# Altium schematic sheet Atrium_Radio_Island.SchDoc
size 420 x 297 mm; Symbol: Drawing-Symbol_A3; @Project Name: Atrium; @Page Count: 1; @Update Date: 2026-11-10; @Create Date: 2026-11-10; @Schematic Name: Radio_Schematic; @Page No: 1; @Page Name: P1; Company: EasyEDA.com; Version: V1.0; Page Size: A3; Device: Drawing-Symbol_A3; @Create Time: 01:51:16; @Update Time: 18:07:46; Border: 1; Width: 1655; Height: 1170; Region Start: 1; X Region Count: 6; Y Region Count: 4; Blade Width: 10; Title Block Position: 3; @Board Name: Radio_Island
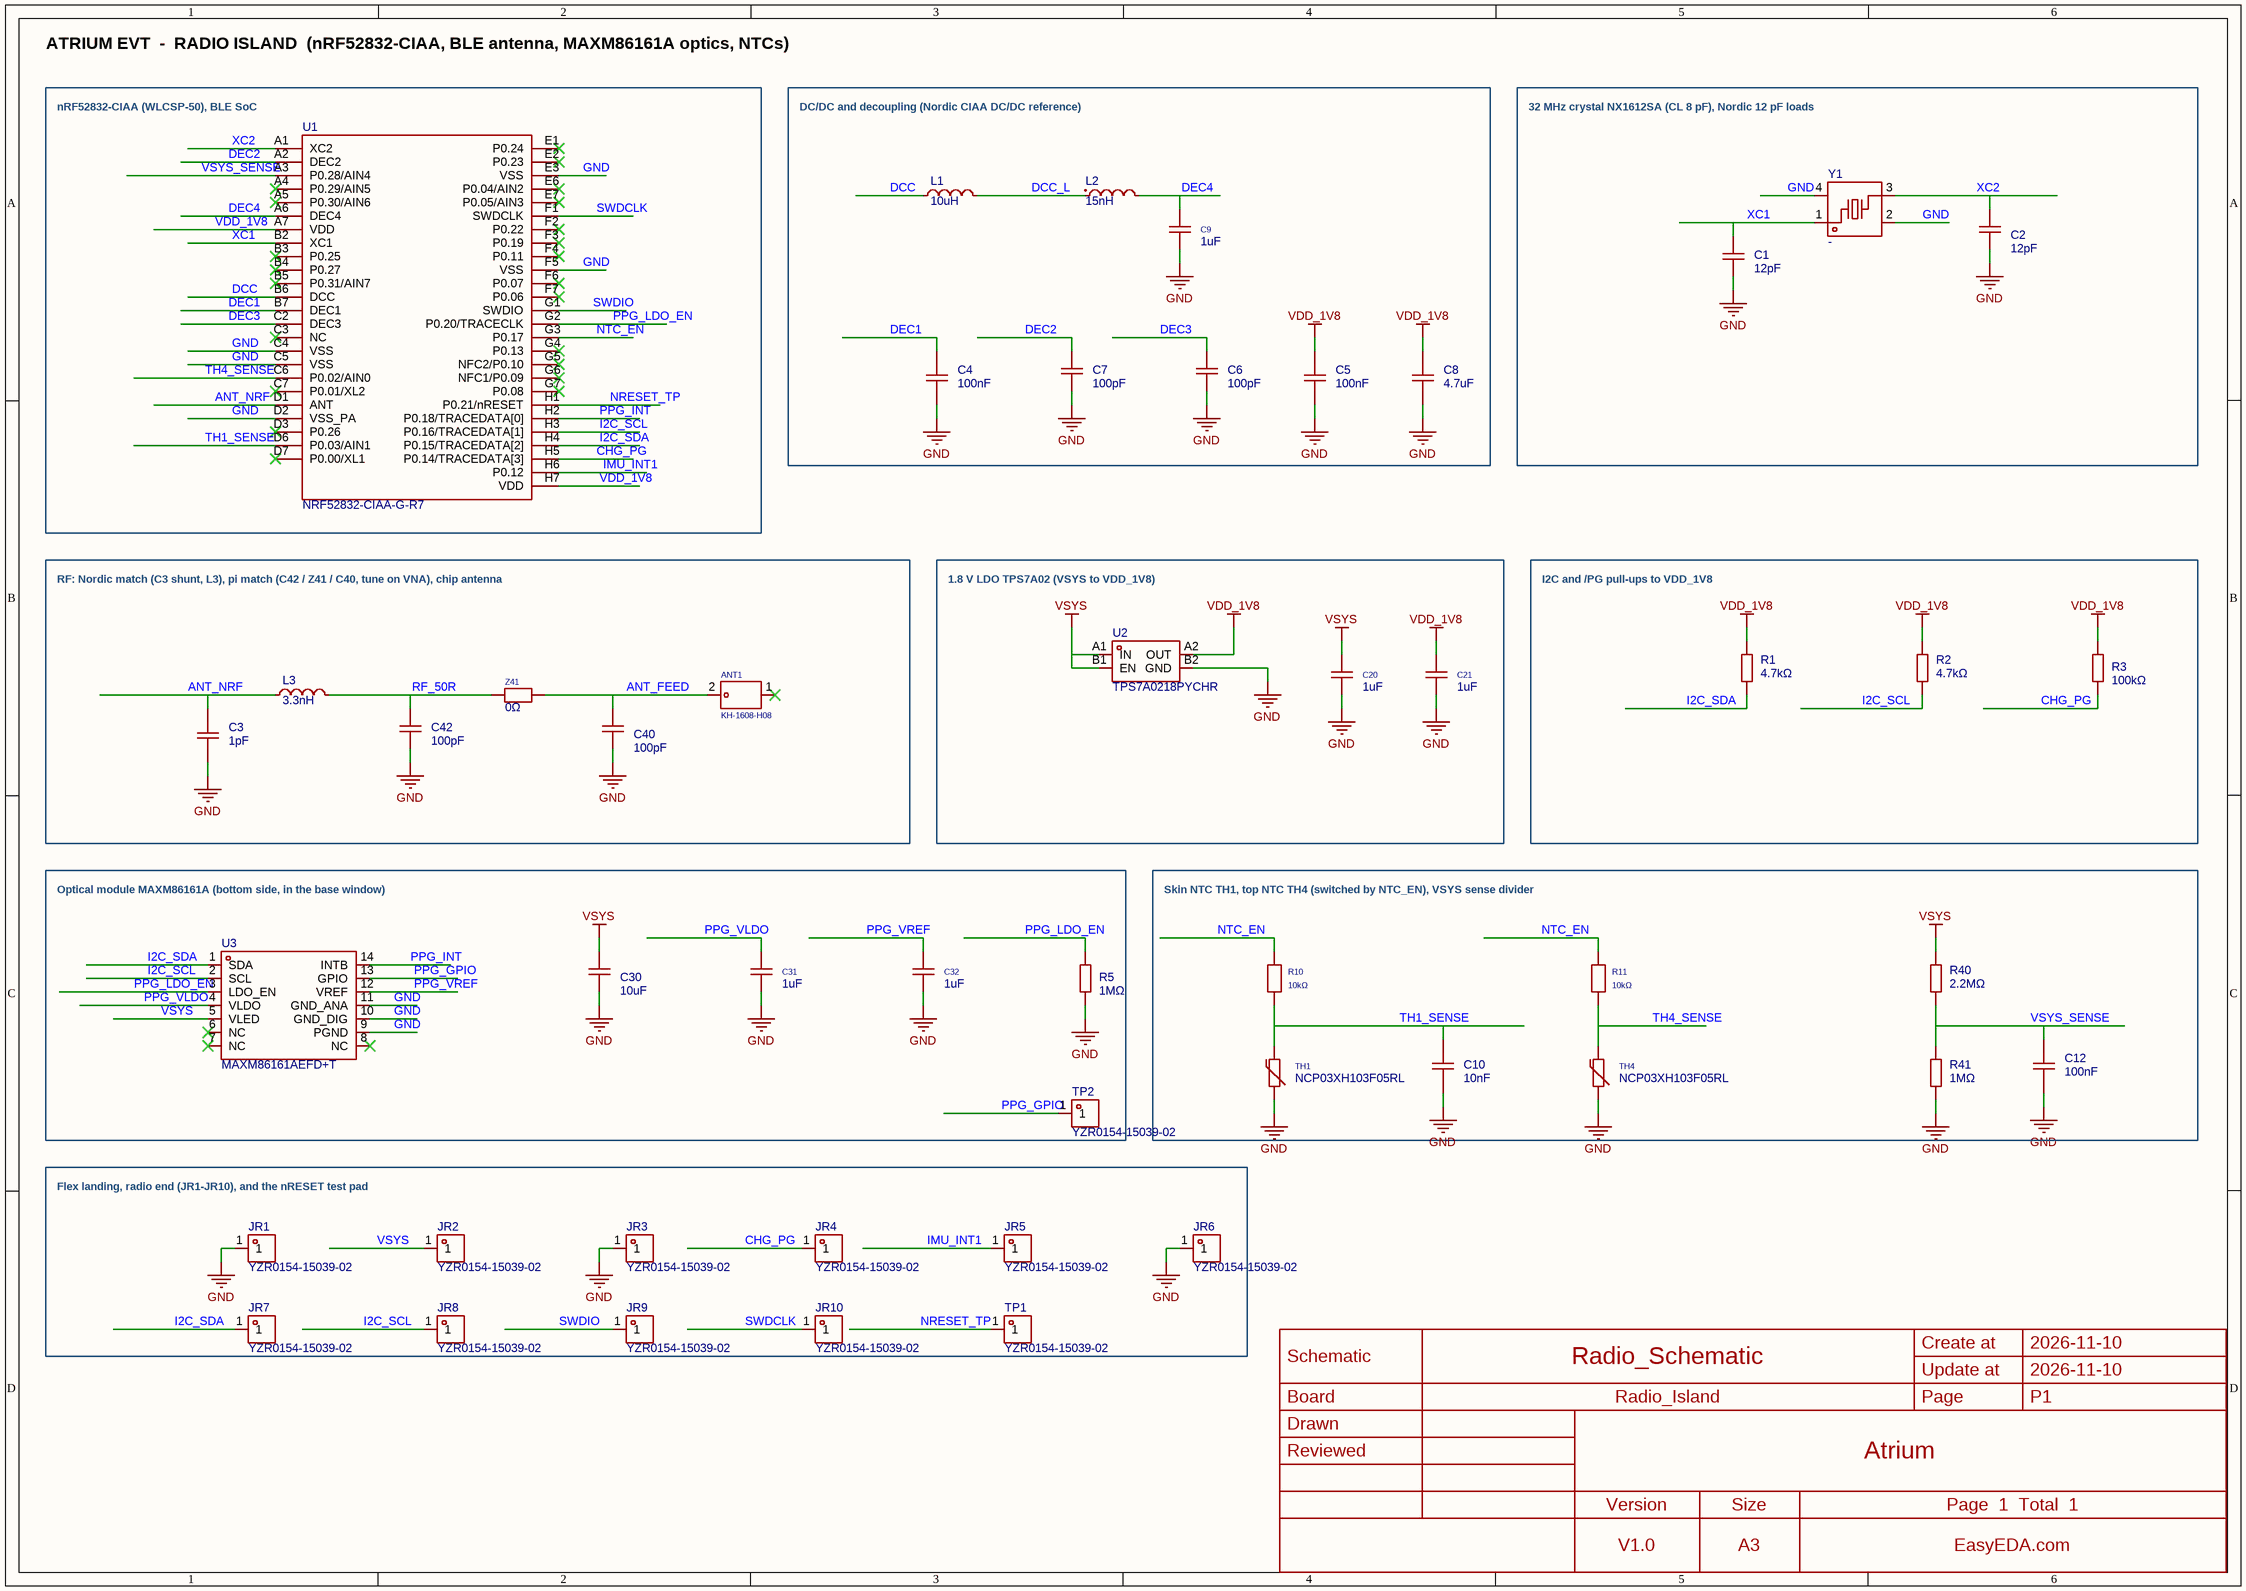
[diagram p0: Atrium_Radio_Island.SchDoc]

## Parts
ANT1  KH-1608-H08  [ANT-SMD_L1.7-W0.9]
C1  12pF  [C0201]
C2  12pF  [C0201]
C3  1pF  [C0201]
C4  100nF  [C0201]
C5  100nF  [C0201]
C6  100pF  [C0201]
C7  100pF  [C0201]
C8  4.7uF  [C0201]
C9  1uF  [C0201]
C10  10nF  [C0201]
C12  100nF  [C0201]
C20  1uF  [C0201]
C21  1uF  [C0201]
C30  10uF  [C0402]
C31  1uF  [C0201]
C32  1uF  [C0201]
C40  100pF  [C0201]
C42  100pF  [C0201]
JR1  YZR0154-15039-02  [TESTPOINT-SMD_BD1.5-H3.9]
JR2  YZR0154-15039-02  [TESTPOINT-SMD_BD1.5-H3.9]
JR3  YZR0154-15039-02  [TESTPOINT-SMD_BD1.5-H3.9]
JR4  YZR0154-15039-02  [TESTPOINT-SMD_BD1.5-H3.9]
JR5  YZR0154-15039-02  [TESTPOINT-SMD_BD1.5-H3.9]
JR6  YZR0154-15039-02  [TESTPOINT-SMD_BD1.5-H3.9]
JR7  YZR0154-15039-02  [TESTPOINT-SMD_BD1.5-H3.9]
JR8  YZR0154-15039-02  [TESTPOINT-SMD_BD1.5-H3.9]
JR9  YZR0154-15039-02  [TESTPOINT-SMD_BD1.5-H3.9]
JR10  YZR0154-15039-02  [TESTPOINT-SMD_BD1.5-H3.9]
L1  10uH  [L0603]
L2  15nH  [L0402-R-RD]
L3  3.3nH  [L0201-RD]
R1  4.7kΩ  [R0201]
R2  4.7kΩ  [R0201]
R3  100kΩ  [R0201]
R5  1MΩ  [R0201]
R10  10kΩ  [R0201]
R11  10kΩ  [R0201]
R40  2.2MΩ  [R0201]
R41  1MΩ  [R0201]
TH1  NCP03XH103F05RL  [R0201]
TH4  NCP03XH103F05RL  [R0201]
TP1  YZR0154-15039-02  [TESTPOINT-SMD_BD1.5-H3.9]
TP2  YZR0154-15039-02  [TESTPOINT-SMD_BD1.5-H3.9]
U1  NRF52832-CIAA-G-R7  [WLCSP-50_L3.2-W3.0-TL_NRF52832]
U2  TPS7A0218PYCHR  [WLCSP-4_L0.6-W0.6-P0.35-R2-C2-TL]
U3  MAXM86161AEFD+T  [OLGA-14_L4.3-W2.9-P0.60-TL]
Y1  -  [CRYSTAL-SMD_4P-L1.6-W1.2-BL]
Z41  0Ω  [R0201]

## Blocks framed on the sheet
nRF52832-CIAA (WLCSP-50), BLE SoC: U1
DC/DC and decoupling (Nordic CIAA DC/DC reference): C4-C9 L1 L2
32 MHz crystal NX1612SA (CL 8 pF), Nordic 12 pF loads: C1 C2 Y1
1.8 V LDO TPS7A02 (VSYS to VDD_1V8): C20 C21 U2
I2C and /PG pull-ups to VDD_1V8: R1-R3
Optical module MAXM86161A (bottom side, in the base window): C30-C32 R5 TP2 U3
Flex landing, radio end (JR1-JR10), and the nRESET test pad: JR1-JR10 TP1

## Nets
GND: C1.2 C2.2 C3.2 C4.2 C5.2 C6.2 C7.2 C8.2 C9.2 C10.2 C12.2 C20.2 C21.2 C30.2 C31.2 C32.2 C40.2 C42.2 JR1.1 JR3.1 JR6.1 R5.2 R41.2 TH1.2 TH4.2 U1.C4(VSS) U1.C5(VSS) U1.D2(VSS_PA) U1.E3(VSS) U1.F5(VSS) U2.B2(GND) U3.9(PGND) U3.10(GND_DIG) U3.11(GND_ANA) Y1.2(GND) Y1.4(GND)
VDD_1V8: C5.1 C8.1 C21.1 R1.1 R2.1 R3.1 U1.A7(VDD) U1.H7(VDD) U2.A2(OUT)
VSYS: C20.1 C30.1 JR2.1 R40.1 U2.A1(IN) U2.B1(EN) U3.5(VLED)
ANT_FEED: ANT1.2(FEED) C40.1 Z41.2
ANT_NRF: C3.1 L3.1 U1.D1(ANT)
CHG_PG: JR4.1 R3.2 U1.H5(P0.14/TRACEDATA[3])
DCC: L1.1 U1.B6(DCC)
DCC_L: L1.2 L2.1
DEC1: C4.1 U1.B7(DEC1)
DEC2: C7.1 U1.A2(DEC2)
DEC3: C6.1 U1.C2(DEC3)
DEC4: C9.1 L2.2 U1.A6(DEC4)
I2C_SCL: JR8.1 R2.2 U1.H3(P0.16/TRACEDATA[1]) U3.2(SCL)
I2C_SDA: JR7.1 R1.2 U1.H4(P0.15/TRACEDATA[2]) U3.1(SDA)
IMU_INT1: JR5.1 U1.H6(P0.12)
NRESET_TP: TP1.1 U1.H1(P0.21/nRESET)
NTC_EN: R10.1 R11.1 U1.G3(P0.17)
PPG_GPIO: TP2.1 U3.13(GPIO)
PPG_INT: U1.H2(P0.18/TRACEDATA[0]) U3.14(INTB)
PPG_LDO_EN: R5.1 U1.G2(P0.20/TRACECLK) U3.3(LDO_EN)
PPG_VLDO: C31.1 U3.4(VLDO)
PPG_VREF: C32.1 U3.12(VREF)
RF_50R: C42.1 L3.2 Z41.1
SWDCLK: JR10.1 U1.F1(SWDCLK)
SWDIO: JR9.1 U1.G1(SWDIO)
TH1_SENSE: C10.1 R10.2 TH1.1 U1.D6(P0.03/AIN1)
TH4_SENSE: R11.2 TH4.1 U1.C6(P0.02/AIN0)
VSYS_SENSE: C12.1 R40.2 R41.1 U1.A3(P0.28/AIN4)
XC1: C1.1 U1.B2(XC1) Y1.1
XC2: C2.1 U1.A1(XC2) Y1.3

Not connected (* = marked no-connect by the designer): ANT1 1*; U1 A4(P0.29/AIN5)* A5(P0.30/AIN6)* B3(P0.25)* B4(P0.27)* B5(P0.31/AIN7)* C3(NC)* C7(P0.01/XL2)* D3(P0.26)* D7(P0.00/XL1)* E1(P0.24)* E2(P0.23)* E6(P0.04/AIN2)* E7(P0.05/AIN3)* F2(P0.22)* F3(P0.19)* F4(P0.11)* F6(P0.07)* F7(P0.06)* G4(P0.13)* G5(NFC2/P0.10)* G6(NFC1/P0.09)* G7(P0.08)*; U3 6(NC)* 7(NC)* 8(NC)*

## Notes on the sheet
- ATRIUM EVT  -  RADIO ISLAND  (nRF52832-CIAA, BLE antenna, MAXM86161A optics, NTCs)
- RF: Nordic match (C3 shunt, L3), pi match (C42 / Z41 / C40, tune on VNA), chip antenna
- Skin NTC TH1, top NTC TH4 (switched by NTC_EN), VSYS sense divider
- Create at
- 2026-11-10
- Schematic
- Board
- Radio_Schematic
- Radio_Island
- Update at
- Page
- P1
- Drawn
- Reviewed
- Atrium
- Version
- V1.0
- Size
- A3
- Page  1  Total  1
- EasyEDA.com

## Library data of the parts
ANT1 = KH-1608-H08: Frequency(Center/Band):2.45GHz Bandwidth:120MHz Peak Gain:2.28dBi Peak Gain:2.28dBi Impedance:50Ω Power:4W Operating Temperature:-40℃~+110℃ Operating Temperature:-40℃~+110℃ Length:1.7mm Width:0.93mm Height:0.75mm; Manufacturer: kinghelm(金航标); Add into BOM: yes; Bandwidth: 120MHz; Impedance: 50Ω; Power: 4W; ModelId: ff23d9f3beb34336bc6e8b44e5e139dd0819f05c4eef4c71ace90d822a990e87; ModelTransform: 66.929,36.65347,0,0,0,0,0,0,0; Symbol: KH-1608-H08; Device: KH-1608-H08; Convert to PCB: yes; Manufacturer Part: KH-1608-H08; Supplier: LCSC; Supplier Part: C2925416; LCSC Part Name: KH-1608-H08; Supplier Footprint: 0603; JLCPCB Part Class: Extended Part; Datasheet: https://item.szlcsc.com/datasheet/KH-1608-H08/3244678.html; Frequency(Center/Band): 2.45GHz; Peak Gain: 2.28dBi; Operating Temperature: -40℃~+110℃; Length: 1.7mm; Width: 0.93mm; Height: 0.75mm; FootprintName: ANT-SMD_L1.7-W0.9; ModelName: ANT-SMD_L1.7-W0.9
C1 C2 = GRM0335C1H120GA01D: Capacitance:12pF Tolerance:±2% Tolerance:±2% Voltage Rating:50V Temperature Coefficient:C0G; Manufacturer: muRata(村田); Add into BOM: yes; Tolerance: ±2%; Voltage Rating: 50V; Temperature Coefficient: C0G; ModelId: c3e75c3d90204c70b153866ab54c789f0819f05c4eef4c71ace90d822a990e87; ModelName: C0201_L0.6-W0.3-H0.3; ModelTransform: 23.622,11.811,0,0,0,0,0,0,0; Symbol: GRM0335C1H120GA01D; Device: GRM0335C1H120GA01D; Convert to PCB: yes; Manufacturer Part: GRM0335C1H120GA01D; Supplier: LCSC; Supplier Part: C161404; LCSC Part Name: 12pF ±2% 50V; Supplier Footprint: 0201; JLCPCB Part Class: Extended Part; Datasheet: https://item.szlcsc.com/datasheet/GRM0335C1H120GA01D/172785.html; Value: 12pF; FootprintName: C0201
C3 = GJM0335C1H1R0BB01D: Capacitance: Voltage Rated: Temperature Coefficient:; Manufacturer: muRata(村田); Add into BOM: yes; 3D Model: c3e75c3d90204c70b153866ab54c789f0819f05c4eef4c71ace90d822a990e87; 3D Model Transform: 23.622,11.811,0,0,0,0,0,0,0; ModelName: C0201_L0.6-W0.3-H0.3; Symbol: GJM0335C1H1R0BB01D; Device: GJM0335C1H1R0BB01D; Convert to PCB: yes; LCSC Part Name: 1pF 50V; Supplier Part: C237514; Manufacturer Part: GJM0335C1H1R0BB01D; Supplier Footprint: 0201; JLCPCB Part Class: Extended Part; Datasheet: https://atta.szlcsc.com/upload/public/pdf/source/20181211/C237514_B3409DDFEFAC0419E560973322D8BE24.pdf; Supplier: LCSC; Value: 1pF; FootprintName: C0201
C4 C5 C12 = GRM033R60J104KE19D: Capacitance:100nF Tolerance:±10% Tolerance:±10% Voltage Rating:6.3V Temperature Coefficient:X5R; Manufacturer: muRata(村田); Add into BOM: yes; Tolerance: ±10%; Voltage Rating: 6.3V; Temperature Coefficient: X5R; ModelId: c3e75c3d90204c70b153866ab54c789f0819f05c4eef4c71ace90d822a990e87; ModelName: C0201_L0.6-W0.3-H0.3; ModelTransform: 23.622,11.811,0,0,0,0,0,0,0; Symbol: GRM033R60J104KE19D; Device: GRM033R60J104KE19D; Convert to PCB: yes; Manufacturer Part: GRM033R60J104KE19D; Supplier: LCSC; Supplier Part: C76928; LCSC Part Name: 100nF ±10% 6.3V; Supplier Footprint: 0201; JLCPCB Part Class: Extended Part; Datasheet: https://item.szlcsc.com/datasheet/GRM033R60J104KE19D/78055.html; Value: 100nF; FootprintName: C0201
C6 C7 = 0201CG101J500NT: Capacitance:100pF Tolerance:±5% Tolerance:±5% Voltage Rating:50V Temperature Coefficient:C0G; Manufacturer: FH(风华); Add into BOM: yes; Tolerance: ±5%; Voltage Rating: 50V; Temperature Coefficient: C0G; ModelId: c3e75c3d90204c70b153866ab54c789f0819f05c4eef4c71ace90d822a990e87; ModelName: C0201_L0.6-W0.3-H0.3; ModelTransform: 23.622,11.811,0,0,0,0,0,0,0; Symbol: 0201CG101J500NT; Device: 0201CG101J500NT; Convert to PCB: yes; Manufacturer Part: 0201CG101J500NT; Supplier: LCSC; Supplier Part: C62550; LCSC Part Name: 100pF ±5% 50V; Supplier Footprint: 0201; JLCPCB Part Class: Extended Part; Datasheet: https://item.szlcsc.com/datasheet/0201CG101J500NT/63610.html; Value: 100pF; FootprintName: C0201
C8 = GRM035R60J475ME15D: Capacitance:4.7uF Tolerance:±20% Tolerance:±20% Voltage Rating:6.3V Temperature Coefficient:X5R; Manufacturer: muRata(村田); Add into BOM: yes; Tolerance: ±20%; Voltage Rating: 6.3V; Temperature Coefficient: X5R; ModelId: c3e75c3d90204c70b153866ab54c789f0819f05c4eef4c71ace90d822a990e87; ModelName: C0201_L0.6-W0.3-H0.3; ModelTransform: 23.622,11.811,0,0,0,0,0,0,0; Symbol: GRM035R60J475ME15D; Device: GRM035R60J475ME15D; Convert to PCB: yes; Manufacturer Part: GRM035R60J475ME15D; Supplier: LCSC; Supplier Part: C335103; LCSC Part Name: 4.7uF ±20% 6.3V; Supplier Footprint: 0201; JLCPCB Part Class: Extended Part; Datasheet: https://item.szlcsc.com/datasheet/GRM035R60J475ME15D/313624.html; Value: 4.7uF; FootprintName: C0201
C9 C20 C21 C31 C32 = GRM033R60J105KEA2D: Capacitance:1uF Tolerance:±10% Tolerance:±10% Voltage Rating:6.3V Temperature Coefficient:X5R; Manufacturer: muRata(村田); Add into BOM: yes; Tolerance: ±10%; Voltage Rating: 6.3V; Temperature Coefficient: X5R; ModelId: c3e75c3d90204c70b153866ab54c789f0819f05c4eef4c71ace90d822a990e87; ModelName: C0201_L0.6-W0.3-H0.3; ModelTransform: 23.622,11.811,0,0,0,0,0,0,0; Symbol: GRM033R60J105KEA2D; Device: GRM033R60J105KEA2D; Convert to PCB: yes; Manufacturer Part: GRM033R60J105KEA2D; Supplier: LCSC; Supplier Part: C76929; Value: 1uF; JLCPCB Part Class: Extended Part; LCSC Part Name: 1uF ±10% 6.3V; Supplier Footprint: 0201; Datasheet: https://item.szlcsc.com/datasheet/GRM033R60J105KEA2D/78056.html; FootprintName: C0201
C10 = 0201B103K250NT: Capacitance:10nF Tolerance:±10% Tolerance:±10% Voltage Rating:25V Temperature Coefficient:X7R; Manufacturer: FH(风华); Add into BOM: no; Convert to PCB: yes; Tolerance: ±10%; Voltage Rating: 25V; Temperature Coefficient: X7R; ModelId: c3e75c3d90204c70b153866ab54c789f0819f05c4eef4c71ace90d822a990e87; ModelName: C0201_L0.6-W0.3-H0.3; ModelTransform: 23.622,11.811,0,0,0,0,0,0,0; Symbol: 0201B103K250NT; Device: 0201B103K250NT; Manufacturer Part: 0201B103K250NT; Supplier: LCSC; Supplier Part: C285010; LCSC Part Name: 10nF ±10% 25V; Supplier Footprint: 0201; JLCPCB Part Class: Extended Part; Datasheet: https://item.szlcsc.com/datasheet/0201B103K250NT/270435.html; Value: 10nF; FootprintName: C0201
C30 = CL05A106MQ5NUNC: Capacitance:10uF Tolerance:±20% Tolerance:±20% Voltage Rating:6.3V Temperature Coefficient:X5R; Manufacturer: SAMSUNG(三星); Add into BOM: yes; 3D Model: b7d13df3e9464d7a99d0651d1a5b4d570819f05c4eef4c71ace90d822a990e87; 3D Model Transform: 39.37,19.685,0,0,0,0,0,0,0; Tolerance: ±20%; Voltage Rating: 6.3V; Temperature Coefficient: X5R; ModelName: C0402_L1.0-W0.5-H0.5; Symbol: CL05A106MQ5NUNC; Device: CL05A106MQ5NUNC; Convert to PCB: yes; LCSC Part Name: 10uF ±20% 6.3V; Supplier Part: C15525; Manufacturer Part: CL05A106MQ5NUNC; Supplier Footprint: 0402; JLCPCB Part Class: Basic Part; Datasheet: https://item.szlcsc.com/datasheet/CL05A106MQ5NUNC/16204.html; Supplier: LCSC; Value: 10uF; FootprintName: C0402
C40 C42 = 0201CG101J500NT: Capacitance:100pF Tolerance:±5% Tolerance:±5% Voltage Rating:50V Temperature Coefficient:C0G; Manufacturer: FH(风华); Add into BOM: no; Convert to PCB: yes; Tolerance: ±5%; Voltage Rating: 50V; Temperature Coefficient: C0G; ModelId: c3e75c3d90204c70b153866ab54c789f0819f05c4eef4c71ace90d822a990e87; ModelName: C0201_L0.6-W0.3-H0.3; ModelTransform: 23.622,11.811,0,0,0,0,0,0,0; Symbol: 0201CG101J500NT; Device: 0201CG101J500NT; Manufacturer Part: 0201CG101J500NT; Supplier: LCSC; Supplier Part: C62550; LCSC Part Name: 100pF ±5% 50V; Supplier Footprint: 0201; JLCPCB Part Class: Extended Part; Datasheet: https://item.szlcsc.com/datasheet/0201CG101J500NT/63610.html; Value: 100pF; FootprintName: C0201
JR1-JR10 TP1 TP2 = YZR0154-15039-02: Type:Pogo Pin Number of Pins:1P Overall Length/Height:3.9mm Operational Height:3.1mm Contact Resistance:50mΩ Elastic Life:10000 times Current Rating:1A Voltage Rating:12V Contact Material:Lead-Free Copper Contact Plating:Gold Operating Temperature:-20℃~+7; Manufacturer: Xinyangze(鑫扬泽); Add into BOM: no; Overall Length/Height: 3.9mm; Operational Height: 3.1mm; Contact Resistance: 50mΩ; Current Rating: 1A; Voltage Rating: 12V; Symbol: YZR0154-15039-02; Device: YZR0154-15039-02; Convert to PCB: no; LCSC Part Name: POGO PIN贴片型弹簧顶针; Supplier Part: C5157388; Manufacturer Part: YZR0154-15039-02; Supplier Footprint: -; JLCPCB Part Class: Extended Part; Datasheet: https://item.szlcsc.com/datasheet/YZR0154-15039-02/5795506.html; Supplier: LCSC; Type: Pogo Pin; Number of Pins: 1P; Elastic Life: 10000 times; Contact Material: Lead-Free Copper; Contact Plating: Gold; Operating Temperature: -20℃~+70℃; FootprintName: TESTPOINT-SMD_BD1.5-H3.9
L1 = LQM18FN100M00D: Inductance:10uH Tolerance:±20% Tolerance:±20% Current Rating:50mA Current - Saturation (Isat):50mA DC Resistance(DCR):1.17Ω Q @ Frequency:- Frequency - Self Resonant:30MHz Ratings:-; Manufacturer: muRata(村田); Manufacturer Part: LQM18DN100M70L; Add into BOM: yes; Tolerance: ±20%; Current Rating: 50mA; DC Resistance(DCR): 1.17Ω; Frequency - Self Resonant: 30MHz; ModelId: ece81e7160a84e0c9a4133ba5d41d18a0819f05c4eef4c71ace90d822a990e87; ModelName: L0603_L1.6-W0.8-H0.5_BEAD; ModelTransform: 62.992,31.496,0,180,0,0,0.094,0.629,0; Symbol: LQM18FN100M00D; Device: LQM18FN100M00D; Convert to PCB: yes; Supplier: LCSC; Supplier Part: C713281; LCSC Part Name: 10uH ±20% 50mA 停产; Supplier Footprint: 0603; JLCPCB Part Class: Extended Part; Datasheet: https://item.szlcsc.com/datasheet/LQM18FN100M00D/87259.html; Value: 10uH; Current - Saturation (Isat): 50mA; Q @ Frequency: -; Ratings: -; FootprintName: L0603
L2 = VHF100505HQ15NJT: Inductance:15nH Tolerance:±5% Tolerance:±5% Current Rating:400mA Current - Saturation (Isat):- DC Resistance(DCR):500mΩ Q @ Frequency:- Frequency - Self Resonant:- Ratings:- Type:-; Manufacturer: FH(风华); Add into BOM: yes; Tolerance: ±5%; Current Rating: 400mA; DC Resistance(DCR): 500mΩ; ModelId: 2c5b9f28c4cd4897b73072282c7a3b710819f05c4eef4c71ace90d822a990e87; ModelTransform: 40.1574,20.4724,0,180,0,0,0,0,0; Symbol: VHF100505HQ15NJT; Device: VHF100505HQ15NJT; Convert to PCB: yes; Manufacturer Part: VHF100505HQ15NJT; Supplier: LCSC; Supplier Part: C395049; LCSC Part Name: 15nH ±5%; Supplier Footprint: 0402; JLCPCB Part Class: Extended Part; Datasheet: https://item.szlcsc.com/datasheet/VHF100505HQ15NJT/375465.html; Value: 15nH; Current - Saturation (Isat): -; Q @ Frequency: -; Frequency - Self Resonant: -; Ratings: -; Type: -; FootprintName: L0402-R-RD; ModelName: L0402-R-RD
L3 = LQP03TN3N3B02D: Inductance: Tolerance:- Tolerance:- Rated Current: Current - Saturation (Isat):- DC Resistance (DCR): Q @ Freq:14@500MHz Frequency - Self Resonant: Ratings:; Manufacturer: muRata(村田); Add into BOM: yes; 3D Model: d887176703ad44ad84b18f9ed82e768d0819f05c4eef4c71ace90d822a990e87; 3D Model Transform: 23.622,11.811,0,0,0,0,0,0,0; Symbol: LQP03TN3N3B02D; Device: LQP03TN3N3B02D; Convert to PCB: yes; LCSC Part Name: 3.3nH ±0.1nH; Supplier Part: C98045; Manufacturer Part: LQP03TN3N3B02D; Supplier Footprint: 0201; JLCPCB Part Class: Extended Part; Datasheet: https://atta.szlcsc.com/upload/public/pdf/source/20200107/C157592_7FF58F85BAEF0D918ADFA12AEC0AEBA8.pdf; Supplier: LCSC; Value: 3.3nH; Tolerance: -; Current - Saturation (Isat): -; Q @ Freq: 14@500MHz; FootprintName: L0201-RD; ModelName: L0201-RD
R1 R2 = RC0201FR-074K7L: Type:Thick Film Resistors Resistance: Tolerance:±1% Tolerance:±1% Power(Watts): Overload Voltage (Max): Temperature Coefficient:±200ppm/℃ Temperature Coefficient:±200ppm/℃ Operating Temperature Range:-55℃~+125℃ Operating Temperature Range:-55℃~+125℃; Manufacturer: YAGEO(国巨); Add into BOM: yes; Tolerance: ±1%; ModelId: d3c6830bf3df48b598874c11a7d9c8170819f05c4eef4c71ace90d822a990e87; ModelName: R0201_L0.6-W0.3-H0.3; ModelTransform: 23.622,11.811,0,0,0,0,0,-0.0005,0; Symbol: RC0201FR-074K7L; Device: RC0201FR-074K7L; Convert to PCB: yes; Manufacturer Part: RC0201FR-074K7L; Supplier: LCSC; Supplier Part: C138135; LCSC Part Name: 厚膜电阻 4.7kΩ ±1% 50mW; Supplier Footprint: 0201; JLCPCB Part Class: Extended Part; Datasheet: https://atta.szlcsc.com/upload/public/pdf/source/20181009/C309620_DA5935B6E1D48212CB7A533FE518B3C2.pdf; Type: Thick Film Resistors; Value: 4.7kΩ; Temperature Coefficient: ±200ppm/℃; Operating Temperature Range: -55℃~+125℃; FootprintName: R0201
R3 = 0201WMF1003TEE: Type:Thick Film Resistors Resistance:100kΩ Tolerance:±1% Tolerance:±1% Power(Watts): Overload Voltage (Max): Temperature Coefficient:±200ppm/℃ Temperature Coefficient:±200ppm/℃ Operating Temperature Range:-55℃~+155℃ Operating Temperature Range:-55℃~+155℃; Manufacturer: UNI-ROYAL(厚声); Add into BOM: yes; Tolerance: ±1%; ModelId: d3c6830bf3df48b598874c11a7d9c8170819f05c4eef4c71ace90d822a990e87; ModelName: R0201_L0.6-W0.3-H0.3; ModelTransform: 23.622,11.811,0,0,0,0,0,-0.0005,0; Symbol: 0201WMF1003TEE; Device: 0201WMF1003TEE; Convert to PCB: yes; Manufacturer Part: 0201WMF1003TEE; Supplier: LCSC; Supplier Part: C270364; LCSC Part Name: 100kΩ ±1% 50mW 厚膜电阻; Supplier Footprint: 0201; JLCPCB Part Class: Extended Part; Datasheet: https://atta.szlcsc.com/upload/public/pdf/source/20200306/C422600_1E6D84923E4A46A82E41ADD87F860B5C.pdf; Type: Thick Film Resistors; Value: 100kΩ; Temperature Coefficient: ±200ppm/℃; Operating Temperature Range: -55℃~+155℃; FootprintName: R0201
R5 R41 = RC0201FR-071ML: Type:Thick Film Resistor Resistance:1MΩ Tolerance:±1% Tolerance:±1% Power(Watts):50mW Voltage-Supply(Max):25V Temperature Coefficient:±200ppm/℃ Temperature Coefficient:±200ppm/℃ Operating Temperature:-55℃~+125℃ Operating Temperature:-55℃~+125℃; Manufacturer: YAGEO(国巨); Add into BOM: yes; Tolerance: ±1%; Power(Watts): 50mW; Voltage-Supply(Max): 25V; ModelId: d3c6830bf3df48b598874c11a7d9c8170819f05c4eef4c71ace90d822a990e87; ModelName: R0201_L0.6-W0.3-H0.3; ModelTransform: 23.622,11.811,0,0,0,0,0,-0.0005,0; Symbol: RC0201FR-071ML; Device: RC0201FR-071ML; Convert to PCB: yes; Manufacturer Part: RC0201FR-071ML; Supplier: LCSC; Supplier Part: C295786; LCSC Part Name: 厚膜电阻 1MΩ ±1% 50mW; Supplier Footprint: 0201; JLCPCB Part Class: Extended Part; Datasheet: https://item.szlcsc.com/datasheet/RC0201FR-071ML/280203.html; Type: Thick Film Resistor; Value: 1MΩ; Temperature Coefficient: ±200ppm/℃; Operating Temperature: -55℃~+125℃; FootprintName: R0201
R10 R11 = RT0201BRD0710KL: Type:Thin Film Resistor Resistance:10kΩ Tolerance:±0.1% Tolerance:±0.1% Power(Watts):50mW Voltage-Supply(Max):25V Temperature Coefficient:±25ppm/℃ Temperature Coefficient:±25ppm/℃ Operating Temperature:-55℃~+125℃ Operating Temperature:-55℃~+125℃; Manufacturer: YAGEO(国巨); Add into BOM: yes; 3D Model: d3c6830bf3df48b598874c11a7d9c8170819f05c4eef4c71ace90d822a990e87; 3D Model Transform: 23.622,11.811,0,0,0,0,0,-0.0005,0; Tolerance: ±0.1%; Power(Watts): 50mW; Voltage-Supply(Max): 25V; ModelName: R0201_L0.6-W0.3-H0.3; Symbol: RT0201BRD0710KL; Device: RT0201BRD0710KL; Convert to PCB: yes; LCSC Part Name: 薄膜电阻 10kΩ ±0.1% 50mW; Supplier Part: C852211; Manufacturer Part: RT0201BRD0710KL; Supplier Footprint: 0201; JLCPCB Part Class: Extended Part; Datasheet: https://item.szlcsc.com/datasheet/RT0201BRD0710KL/912533.html; Supplier: LCSC; Type: Thin Film Resistor; Value: 10kΩ; Temperature Coefficient: ±25ppm/℃; Operating Temperature: -55℃~+125℃; FootprintName: R0201
R40 = RC0201FR-072M2L: Type:Thick Film Resistors Resistance: Tolerance:±1% Tolerance:±1% Power(Watts): Overload Voltage (Max): Temperature Coefficient:±200ppm/℃ Temperature Coefficient:±200ppm/℃ Operating Temperature Range:-55℃~+125℃ Operating Temperature Range:-55℃~+125℃; Manufacturer: YAGEO(国巨); Add into BOM: yes; Tolerance: ±1%; ModelId: d3c6830bf3df48b598874c11a7d9c8170819f05c4eef4c71ace90d822a990e87; ModelName: R0201_L0.6-W0.3-H0.3; ModelTransform: 23.622,11.811,0,0,0,0,0,-0.0005,0; Symbol: RC0201FR-072M2L; Device: RC0201FR-072M2L; Convert to PCB: yes; Manufacturer Part: RC0201FR-072M2L; Supplier: LCSC; Supplier Part: C474576; LCSC Part Name: 厚膜电阻 2.2MΩ ±1% 50mW; Supplier Footprint: 0201; JLCPCB Part Class: Extended Part; Datasheet: https://atta.szlcsc.com/upload/public/pdf/source/20181031/C326976_E9901E35333D136A19B6CE377E889A82.pdf; Type: Thick Film Resistors; Value: 2.2MΩ; Temperature Coefficient: ±200ppm/℃; Operating Temperature Range: -55℃~+125℃; FootprintName: R0201
TH1 TH4 = NCP03XH103F05RL: Resistance @ 25℃:10kΩ B Constant (25℃/50℃):3380K Resistance Tolerance:±1% Resistance Tolerance:±1% B Constant (25℃/85℃):3434K B Constant (25℃/100℃):3455K Power(Watts):100mW B Constant Tolerance:±1% Operating Temperature:-40℃~+125℃ Operating Temperature:-4; Manufacturer: muRata(村田); Add into BOM: yes; 3D Model: d3c6830bf3df48b598874c11a7d9c8170819f05c4eef4c71ace90d822a990e87; 3D Model Transform: 23.622,11.811,0,0,0,0,0,-0.0005,0; Resistance @ 25℃: 10kΩ; B Constant (25℃/50℃): 3380K; Resistance Tolerance: ±1%; B Constant (25℃/85℃): 3434K; B Constant (25℃/100℃): 3455K; Power(Watts): 100mW; Dissipation Factor: 1mW/℃; Value: 10KΩ; ModelName: R0201_L0.6-W0.3-H0.3; Symbol: NCP03XH103F05RL; Device: NCP03XH103F05RL; Convert to PCB: yes; LCSC Part Name: 10kΩ 3380K 100mW; Supplier Footprint: 0201; Datasheet: https://item.szlcsc.com/datasheet/NCP03XH103F05RL/99307.html; B Constant Tolerance: ±1%; Operating Temperature: -40℃~+125℃; Manufacturer Part: NCP03XH103F05RL; Supplier: LCSC; Supplier Part: C98098; JLCPCB Part Class: Extended Part; FootprintName: R0201
U1 = NRF52832-CIAA-R: Frequency Range:2.4GHz~2.4835GHz Frequency Range:2.4GHz~2.4835GHz Interface:I2S；UART；SPI Voltage - Supply:1.7V~3.6V Voltage - Supply:1.7V~3.6V Applications:Bluetooth Output Power:4dBm Data Rate:2Mbps Current Of Transmitting:5.3mA Sensitivity:-96dBm Receiv; Manufacturer: NORDIC; Add into BOM: yes; 3D Model: 1576cd53141c4e44b7a8ff53a3ab85980819f05c4eef4c71ace90d822a990e87; 3D Model Transform: 118.11,125.984,0,0,0,0,0,0,0; Output Power: 4dBm; Data Rate: 2Mbps; Current Of Transmitting: 5.3mA; Sensitivity: -96dBm; Receive Current: 5.4mA; Typical Application Frequency: 2.4GHz; ModelName: WLCSP-50_L3.2-W3.0-H0.4-TL_NRF52832; Symbol: NRF52832-CIAA-R; Device: NRF52832-CIAA-R; Convert to PCB: yes; LCSC Part Name: 2.4 GHz收发器，蓝牙低功耗模式，ARM Cortex-M4处理器，多协议支持; Supplier Part: C3606951; Manufacturer Part: NRF52832-CIAA-G-R7; Supplier Footprint: WLCSP-50(3x3.2); JLCPCB Part Class: Extended Part; Datasheet: https://item.szlcsc.com/datasheet/NRF52832-CIAA-R/523264.html; Supplier: LCSC; Frequency Range: 2.4GHz~2.4835GHz; Interface: I2S；UART；SPI; Voltage - Supply: 1.7V~3.6V; Applications: Bluetooth; Operating Temperature: -40℃~+85℃; Type: transceiver; Features: CRC check function；Supports RSSI function; FootprintName: WLCSP-50_L3.2-W3.0-TL_NRF52832
U2 = TPS7A0218PYCHR: Output Configuration:Positive Voltage - Supply:6V Output Voltage:1.8V Output Voltage:1.8V Output Current:200mA Power Supply Rejection Ratio (PSRR):55dB@(1kHz) Voltage Dropout:490mV@(200mA) standby current:25nA Noise:130uVrms Features:Enable control；Output; Manufacturer: TI(德州仪器); Add into BOM: yes; Voltage - Supply: 6V; Output Voltage: 1.8V; standby current: 25nA; Output Type: Fixed; Number of Outputs: 1; ModelId: 45b24646604d4389881586579a55f4670819f05c4eef4c71ace90d822a990e87; ModelName: WLCSP-4_L0.6-W0.6-H0.4-P0.35-R2-C2-TL; ModelTransform: 25.78735,25.78735,0,0,0,0,0,0,0; Symbol: TPS7A0218PYCHR; Device: TPS7A0218PYCHR; Convert to PCB: yes; Manufacturer Part: TPS7A0218PYCHR; Supplier: LCSC; Supplier Part: C3752366; LCSC Part Name: 1.8V 200mA 6V; Supplier Footprint: DSBGA-4(0.7x1.4); JLCPCB Part Class: Extended Part; Datasheet: https://www.ti.com/cn/lit/ds/symlink/tps7a02.pdf; Output Configuration: Positive; Output Current: 200mA; Power Supply Rejection Ratio (PSRR): 55dB@(1kHz); Voltage Dropout: 490mV@(200mA); Noise: 130uVrms; Features: Enable control；Output discharge；Over Current Protection；Thermal shutdown；Input under-voltage protection; Operating Temperature: -40℃~+125℃@(Tj); FootprintName: WLCSP-4_L0.6-W0.6-P0.35-R2-C2-TL
U3 = MAXM86161EFD+T: Sensor Type:Optical Sensor Interface:I2C Voltage - Supply:3V~5.5V Voltage - Supply:3V~5.5V Current - Supply:1.6uA Operating Temperature:-40℃~+85℃ Operating Temperature:-40℃~+85℃ Diameter (φD):- Length:4.3mm Width:2.9mm Height:1.4mm Pitch:- Features:FIFO d; Manufacturer: Analog Devices; Add into BOM: yes; Interface: I2C; Current - Supply: 1.6uA; Symbol: MAXM86161EFD+T; Device: MAXM86161EFD+T; Convert to PCB: yes; LCSC Part Name: 单电源集成光学模块用于心率和血氧饱和度测量; Supplier Part: C54021201; Manufacturer Part: MAXM86161AEFD+T; Supplier Footprint: OLGA-14(2.9x4.3); JLCPCB Part Class: Extended Part; Datasheet: https://item.szlcsc.com/datasheet/MAXM86161EFD%252BT/3740247.html; Supplier: LCSC; Sensor Type: Optical Sensor; Voltage - Supply: 3V~5.5V; Operating Temperature: -40℃~+85℃; Diameter (φD): -; Length: 4.3mm; Width: 2.9mm; Height: 1.4mm; Pitch: -; Features: FIFO data buffer；Integrated ADC；Low-power mode；Digital filtering/signal processing; FootprintName: OLGA-14_L4.3-W2.9-P0.60-TL
Y1 = NX1612SA-32MHZ-STD-CIS-3: Type:- Frequency:- Load Capacitance:- Operating Temperature:- Operating Temperature:-; Manufacturer: NDK; Add into BOM: yes; ModelId: bfeafbc17835430da08e85814a119f670819f05c4eef4c71ace90d822a990e87; ModelTransform: 62.992,47.244,0,0,0,0,0,0,0; Symbol: NX1612SA-32MHZ-STD-CIS-3; Device: NX1612SA-32MHZ-STD-CIS-3; Convert to PCB: yes; Manufacturer Part: NX1612SA-32MHZ-STD-CIS-3; Supplier: LCSC; Supplier Part: C910049; LCSC Part Name: 32MHZ 8pF ±10ppm; Supplier Footprint: SMD1612-4P; JLCPCB Part Class: Extended Part; Datasheet: https://atta.szlcsc.com/upload/public/pdf/source/20201027/C910049_5CBBE0EFD018E6BEF6DC10D49B308B93.pdf; Type: -; Value: -; Load Capacitance: -; Operating Temperature: -; FootprintName: CRYSTAL-SMD_4P-L1.6-W1.2-BL; ModelName: CRYSTAL-SMD_4P-L1.6-W1.2-BL
Z41 = 0201WMF0000TEE: Type:Thick Film Resistor Resistance:0Ω Tolerance:±1% Tolerance:±1% Power(Watts):50mW Voltage-Supply(Max):25V Temperature Coefficient:- Temperature Coefficient:- Operating Temperature:-55℃~+155℃ Operating Temperature:-55℃~+155℃; Manufacturer: UNI-ROYAL(厚声); Add into BOM: yes; 3D Model: d3c6830bf3df48b598874c11a7d9c8170819f05c4eef4c71ace90d822a990e87; 3D Model Transform: 23.622,11.811,0,0,0,0,0,-0.0005,0; Tolerance: ±1%; Power(Watts): 50mW; Voltage-Supply(Max): 25V; ModelName: R0201_L0.6-W0.3-H0.3; Symbol: 0201WMF0000TEE; Device: 0201WMF0000TEE; Convert to PCB: yes; LCSC Part Name: 0Ω ±1% 50mW 厚膜电阻; Supplier Footprint: 0201; Datasheet: https://item.szlcsc.com/datasheet/0201WMF0000TEE/479866.html; Type: Thick Film Resistor; Temperature Coefficient: -; Operating Temperature: -55℃~+155℃; Manufacturer Part: 0201WMF0000TEE; Supplier: LCSC; Supplier Part: C473473; JLCPCB Part Class: Extended Part; Value: 0Ω; FootprintName: R0201